# Altium schematic sheet 5V_Regulator.SchDoc: 5V Regulator
size A4; DocumentNumber: 10; SheetNumber: 15; SheetTotal: 16
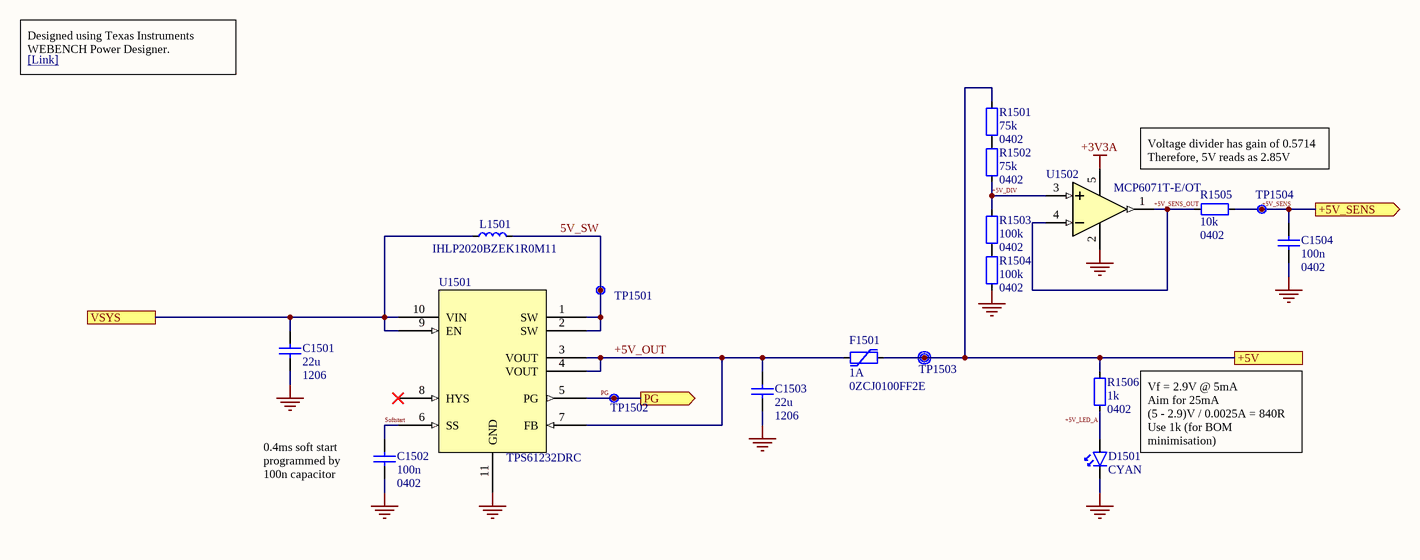
[diagram p0: 5V_Regulator.SchDoc]

## Parts
C1501  22u  Footprint: 1206  [CAP_1206_B]
C1502  100n  Footprint: 0402  [CAP_0402_B]
C1503  22u  Footprint: 1206  [CAP_1206_B]
C1504  100n  Footprint: 0402  [CAP_0402_B]
D1501  CYAN  [SMLD12E3N1WT86]
F1501  1A  [0ZCJ0100FF2E]
L1501  IHLP2020BZEK1R0M11  [IHLP2020BZEK1R0M11]
R1501  75k  Footprint: 0402  [RES_0402_A]
R1502  75k  Footprint: 0402  [RES_0402_A]
R1503  100k  Footprint: 0402  [RES_0402_A]
R1504  100k  Footprint: 0402  [RES_0402_A]
R1505  10k  Footprint: 0402  [RES_0402_A]
R1506  1k  Footprint: 0402  [RES_0402_A]
TP1501  Net  [Unlabelled Testpoint]  (value not drawn)
TP1502  Net  [Unlabelled Testpoint]  (value not drawn)
TP1503  Net  [Labelled Testpoint]  (value not drawn)
TP1504  Net  [Unlabelled Testpoint]  (value not drawn)
U1501  TPS61232DRC  [TPS61232DRCR]
U1502  MCP6071T-E/OT  [MCP6071T-E/OT]

## Ports
+5V (see Top_Level[4B]), +5V_SENS (out, see Top_Level[4B], MCU[2D]), PG (out, see Top_Level[4B]), VSYS (see Top_Level[4B], 3V3_Regulators[1A], Battery_Charging[4C])

## Nets
+3V3A: U1502.5(VDD)
GND: C1501.2 C1502.2 C1503.2 C1504.2 D1501.2 R1504.2(a) U1501.11(GND) U1502.2(VSS)
5V_SW: L1501.1(a) TP1501.1 U1501.1(SW) U1501.2(SW)
+5V: F1501.2(a) R1501.2(a) R1506.1(a) TP1503.1 ; port +5V
+5V_DIV: R1502.1(a) R1503.1(a) U1502.3(VIN+)
+5V_LED_A: D1501.1 R1506.2(a)
+5V_OUT: C1503.1 F1501.1(a) U1501.3(VOUT) U1501.4(VOUT) U1501.7(FB)
+5V_SENS: C1504.1 R1505.2(a) TP1504.1 ; port +5V_SENS
+5V_SENS_OUT: R1505.1(a) U1502.1(VOUT) U1502.4(VIN-)
PG: TP1502.1 U1501.5(PG) ; port PG
Softstart: C1502.1 U1501.6(SS)
VSYS: C1501.1 L1501.2(a) U1501.9(EN) U1501.10(VIN) ; port VSYS
NetR1501_1: R1501.1(a) R1502.2(a)
NetR1503_2: R1503.2(a) R1504.1(a)

Not connected (* = marked no-connect by the designer): U1501 8(HYS)*

## Notes on the sheet
- Designed using Texas Instruments WEBENCH Power Designer.
- [Link] <https://webench.ti.com/appinfo/webench/scripts/SDP.cgi?ID=AD256845D1460620>
- Voltage divider has gain of 0.5714
  Therefore, 5V reads as 2.85V
- Vf = 2.9V @ 5mA
  Aim for 25mA
  (5 - 2.9)V / 0.0025A = 840R
  Use 1k (for BOM minimisation)
- (near C1502) 0.4ms soft start programmed by 100n capacitor

## Library data of the parts
C1501 C1503 = CAP_1206: 1206 SMD Capacitor
C1502 C1504 = CAP_0402: 0402 SMD Capacitor
D1501 = LED_Generic: Part Number: SMLD12E3N1WT86; Supplier 1: DigiKey; Supplier Part Number 1: SMLD12E3N1WT86CT-ND
F1501 = FUSE_GENERIC: Generic Fuse Symbol; Part Number: 0ZCJ0100FF2E; Supplier 1: Avnet; Supplier Part Number 1: 48AC8418
L1501 = IND_GENERIC: 1 µH Shielded Molded Inductor 7.5 A 18.1mOhm Max Nonstandard; Supplier 1: Arrow Electronics; Supplier Part Number 1: IHLP2020BZER1R0M11
R1501-R1506 = RES_0402: 0402 SMD Resistor
TP1501 TP1502 TP1504 = Unlabelled Testpoint: Symbol for an unlabelled testpoint
TP1503 = Labelled Testpoint: Symbol for a labelled testpoint
U1501 = TPS61232DRC: Boost Switching Regulator IC Positive Fixed 5V 1 Output 5A (Switch) 10-VFDFN Exposed Pad; Supplier 1: DigiKey; Supplier Part Number 1: 296-44498-6-ND
U1502 = MCP6071T-E/OT: Standard (General Purpose) Amplifier 1 Circuit Rail-to-Rail SOT-23-5; Supplier 1: Arrow Electronics; Supplier Part Number 1: MCP6071T-E/OT